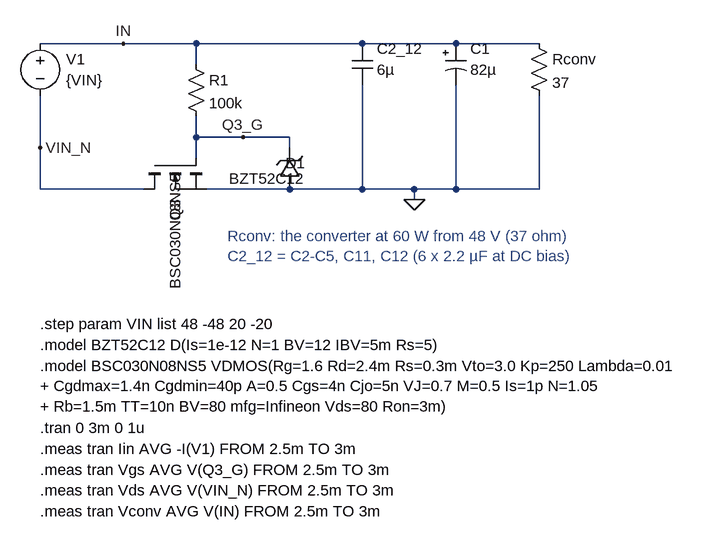
[diagram p0: schematic 04_reverse_polarity.asc]
04_reverse_polarity.asc, the LTspice schematic file:
Version 4.1
SHEET 1 1600 900
WIRE -96 0 -224 0
WIRE 16 0 -96 0
WIRE 272 0 16 0
WIRE 416 0 272 0
WIRE 544 0 416 0
WIRE 16 32 16 0
WIRE 16 144 16 112
WIRE 88 144 16 144
WIRE 160 144 88 144
WIRE -224 160 -224 80
WIRE 160 160 160 144
WIRE 16 176 16 144
WIRE -224 224 -224 160
WIRE -64 224 -224 224
WIRE 160 224 32 224
WIRE 272 224 272 64
WIRE 272 224 160 224
WIRE 352 224 272 224
WIRE 416 224 416 64
WIRE 416 224 352 224
WIRE 544 224 544 80
WIRE 544 224 416 224
WIRE 352 240 352 224
FLAG -96 0 IN
FLAG -224 160 VIN_N
FLAG 88 144 Q3_G
FLAG 352 240 0
SYMBOL voltage -224 -16 R0
WINDOW 0 40 40 Left 2
WINDOW 3 40 72 Left 2
SYMATTR InstName V1
SYMATTR Value {VIN}
SYMATTR SpiceLine Rser=30m
SYMBOL nmos -64 176 M90
WINDOW 0 80 48 Center 2
WINDOW 3 112 48 Center 2
SYMATTR InstName Q3
SYMATTR Value BSC030N08NS5
SYMBOL res 0 16 R0
SYMATTR InstName R1
SYMATTR Value 100k
SYMBOL zener 176 224 R180
WINDOW 0 -8 40 Left 2
WINDOW 3 -8 16 Left 2
SYMATTR InstName D1
SYMATTR Value BZT52C12
SYMBOL cap 256 0 R0
WINDOW 0 38 8 Left 2
WINDOW 3 38 40 Left 2
SYMATTR InstName C2_12
SYMATTR Value 6µ
SYMATTR SpiceLine Rser=2m
SYMBOL polcap 400 0 R0
WINDOW 0 38 8 Left 2
WINDOW 3 38 40 Left 2
SYMATTR InstName C1
SYMATTR Value 82µ
SYMATTR SpiceLine Rser=18m
SYMBOL res 528 -16 R0
SYMATTR InstName Rconv
SYMATTR Value 37
TEXT 64 296 Left 2 ;Rconv: the converter at 60 W from 48 V (37 ohm)\nC2_12 = C2-C5, C11, C12 (6 x 2.2 µF at DC bias)
TEXT -224 432 Left 2 !.step param VIN list 48 -48 20 -20
TEXT -224 464 Left 2 !.model BZT52C12 D(Is=1e-12 N=1 BV=12 IBV=5m Rs=5)
TEXT -224 496 Left 2 !.model BSC030N08NS5 VDMOS(Rg=1.6 Rd=2.4m Rs=0.3m Vto=3.0 Kp=250 Lambda=0.01\n+ Cgdmax=1.4n Cgdmin=40p A=0.5 Cgs=4n Cjo=5n VJ=0.7 M=0.5 Is=1p N=1.05\n+ Rb=1.5m TT=10n BV=80 mfg=Infineon Vds=80 Ron=3m)
TEXT -224 592 Left 2 !.tran 0 3m 0 1u
TEXT -224 624 Left 2 !.meas tran Iin AVG -I(V1) FROM 2.5m TO 3m
TEXT -224 656 Left 2 !.meas tran Vgs AVG V(Q3_G) FROM 2.5m TO 3m
TEXT -224 688 Left 2 !.meas tran Vds AVG V(VIN_N) FROM 2.5m TO 3m
TEXT -224 720 Left 2 !.meas tran Vconv AVG V(IN) FROM 2.5m TO 3m

The netlist it stands for:
* 04_reverse_polarity.asc
V1 IN VIN_N {VIN} Rser=30m
M§Q3 VIN_N Q3_G 0 0 BSC030N08NS5
R1 IN Q3_G 100k
D1 0 Q3_G BZT52C12
C2_12 IN 0 6µ Rser=2m
C1 IN 0 82µ Rser=18m
Rconv IN 0 37
.model D D
.lib standard.dio
.model NMOS NMOS
.model PMOS PMOS
.lib standard.mos
* Rconv: the converter at 60 W from 48 V (37 ohm)
* C2_12 = C2-C5, C11, C12 (6 x 2.2 µF at DC bias)
.step param VIN list 48 -48 20 -20
.model BZT52C12 D(Is=1e-12 N=1 BV=12 IBV=5m Rs=5)
.model BSC030N08NS5 VDMOS(Rg=1.6 Rd=2.4m Rs=0.3m Vto=3.0 Kp=250 Lambda=0.01
+ Cgdmax=1.4n Cgdmin=40p A=0.5 Cgs=4n Cjo=5n VJ=0.7 M=0.5 Is=1p N=1.05
+ Rb=1.5m TT=10n BV=80 mfg=Infineon Vds=80 Ron=3m)
.tran 0 3m 0 1u
.meas tran Iin AVG -I(V1) FROM 2.5m TO 3m
.meas tran Vgs AVG V(Q3_G) FROM 2.5m TO 3m
.meas tran Vds AVG V(VIN_N) FROM 2.5m TO 3m
.meas tran Vconv AVG V(IN) FROM 2.5m TO 3m
.backanno
.end